# Altium schematic sheet LED_Section.SchDoc
size A4
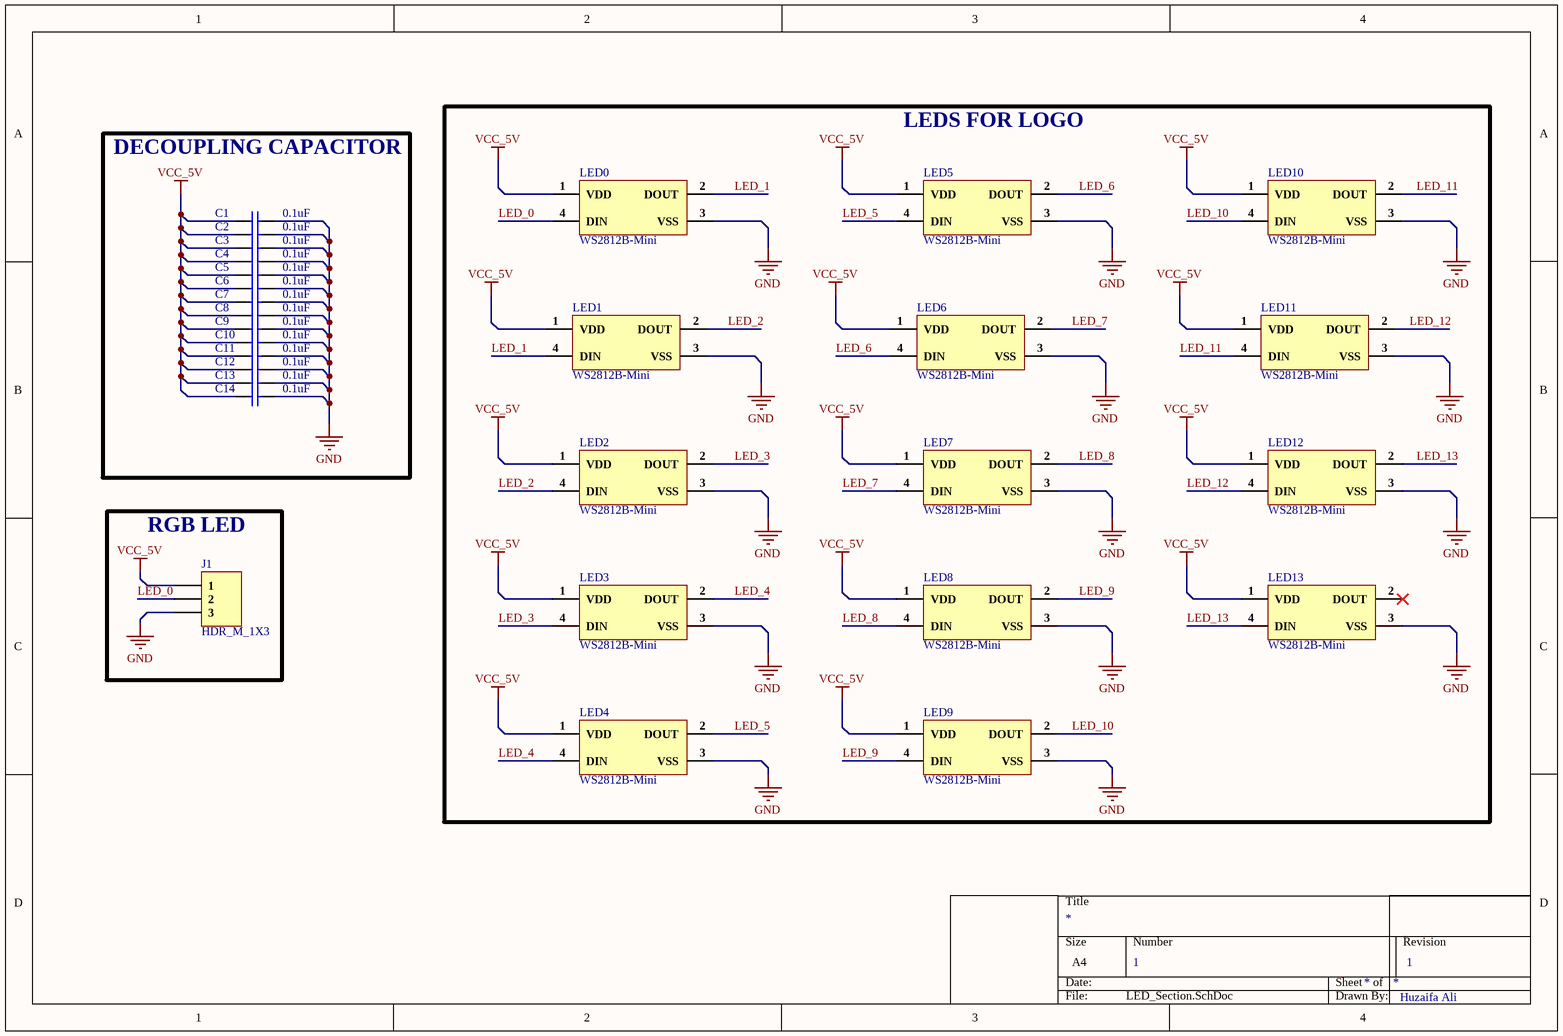
[diagram p0: LED_Section.SchDoc]

## Parts
C1  0.1uF  [CAP 0201]
C2  0.1uF  [CAP 0201]
C3  0.1uF  [CAP 0201]
C4  0.1uF  [CAP 0201]
C5  0.1uF  [CAP 0201]
C6  0.1uF  [CAP 0201]
C7  0.1uF  [CAP 0201]
C8  0.1uF  [CAP 0201]
C9  0.1uF  [CAP 0201]
C10  0.1uF  [CAP 0201]
C11  0.1uF  [CAP 0201]
C12  0.1uF  [CAP 0201]
C13  0.1uF  [CAP 0201]
C14  0.1uF  [CAP 0201]
J1  HDR_M_1X3  [HDR_M_1X3]
LED0  WS2812B-Mini  [WS2812B-Mini]
LED1  WS2812B-Mini  [WS2812B-Mini]
LED2  WS2812B-Mini  [WS2812B-Mini]
LED3  WS2812B-Mini  [WS2812B-Mini]
LED4  WS2812B-Mini  [WS2812B-Mini]
LED5  WS2812B-Mini  [WS2812B-Mini]
LED6  WS2812B-Mini  [WS2812B-Mini]
LED7  WS2812B-Mini  [WS2812B-Mini]
LED8  WS2812B-Mini  [WS2812B-Mini]
LED9  WS2812B-Mini  [WS2812B-Mini]
LED10  WS2812B-Mini  [WS2812B-Mini]
LED11  WS2812B-Mini  [WS2812B-Mini]
LED12  WS2812B-Mini  [WS2812B-Mini]
LED13  WS2812B-Mini  [WS2812B-Mini]

## Blocks framed on the sheet
DECOUPLING CAPACITOR: C1-C14
LEDS FOR LOGO: LED0-LED13
RGB LED: J1

## Nets
GND: C1.2 C2.2 C3.2 C4.2 C5.2 C6.2 C7.2 C8.2 C9.2 C10.2 C11.2 C12.2 C13.2 C14.2 J1.3 LED0.3(VSS) LED1.3(VSS) LED2.3(VSS) LED3.3(VSS) LED4.3(VSS) LED5.3(VSS) LED6.3(VSS) LED7.3(VSS) LED8.3(VSS) LED9.3(VSS) LED10.3(VSS) LED11.3(VSS) LED12.3(VSS) LED13.3(VSS)
VCC_5V: C1.1 C2.1 C3.1 C4.1 C5.1 C6.1 C7.1 C8.1 C9.1 C10.1 C11.1 C12.1 C13.1 C14.1 J1.1 LED0.1(VDD) LED1.1(VDD) LED2.1(VDD) LED3.1(VDD) LED4.1(VDD) LED5.1(VDD) LED6.1(VDD) LED7.1(VDD) LED8.1(VDD) LED9.1(VDD) LED10.1(VDD) LED11.1(VDD) LED12.1(VDD) LED13.1(VDD)
LED_0: J1.2 LED0.4(DIN)
LED_1: LED0.2(DOUT) LED1.4(DIN)
LED_2: LED1.2(DOUT) LED2.4(DIN)
LED_3: LED2.2(DOUT) LED3.4(DIN)
LED_4: LED3.2(DOUT) LED4.4(DIN)
LED_5: LED4.2(DOUT) LED5.4(DIN)
LED_6: LED5.2(DOUT) LED6.4(DIN)
LED_7: LED6.2(DOUT) LED7.4(DIN)
LED_8: LED7.2(DOUT) LED8.4(DIN)
LED_9: LED8.2(DOUT) LED9.4(DIN)
LED_10: LED9.2(DOUT) LED10.4(DIN)
LED_11: LED10.2(DOUT) LED11.4(DIN)
LED_12: LED11.2(DOUT) LED12.4(DIN)
LED_13: LED12.2(DOUT) LED13.4(DIN)

Not connected (* = marked no-connect by the designer): LED13 2(DOUT)*

## Notes on the sheet
- 1
- Huzaifa Ali

## Library data of the parts
C1-C14 = CC0201KRX5R6BB104: Cap Ceramic 0.1uF 10V X5R 10% SMD 0201 85C Paper T/R; Manufacturer: Yageo; Capacitance: 100nF; Supplier 1: Avnet; Manufacturer Part Number: CC0201KRX5R6BB104; RoHS: Yes; Category: Ceramic Capacitors; Stock 1: 2530000; Pricing 1: 15000=0.00489, 30000=0.00489, 60000=0.00488, 90000=0.00488, 120000=0.00487, 150000=0.00486, 1500000=0.00485 (USD); Mount: Surface Mount; Case/Package: 0201; Case Code (Imperial): 0201; Case Code (Metric): 0603; Weight: 6E-06oz; Min Operating Temperature: -55°C; Max Operating Temperature: 85°C; Tolerance: 10%; Dielectric: X5R; Voltage Rating (DC): 10V; Packaging: Tape and Reel; Termination: SMD/SMT; Resistor Type: Ceramic; Voltage Rating: 10V; Series: CC; Construction: Flat; Length: 0.6mm; Width: 0.012inch; Height: 0.3mm; Thickness: 0.013inch; Depth: 0.3mm; Radiation Hardening: No; Lead Free: Lead Free; Halogen Free: Halogen Free; RoHS Compliant: Yes; ComponentLink1URL: https://datasheet.ciiva.com/11587/upy-gphc-x5r-4v-to-50v-12-11587190.pdf?src-supplier=Avnet; ComponentLink1Description: https://datasheet.ciiva.com/11587/upy-gphc-x5r-4v-to-50v-12-11587190.pdf?src-supplier=Avnet; ComponentLink2URL: https://datasheet.ciiva.com/17437/upy-gphc-x5r-4v-to-50v-12-17437495.pdf?src-supplier=Avnet+Europe; ComponentLink2Description: https://datasheet.ciiva.com/17437/upy-gphc-x5r-4v-to-50v-12-17437495.pdf?src-supplier=Avnet+Europe; Supplier Part Number 1: CC0201KRX5R6BB104
J1 = HDR_M_1X3: 3 POS 2.54mm spacer header; Manufacturer: E-SIMPO; Current Rating: 1Amps; Pitch: 2.54mm; ComponentLink1Description: AliE; ComponentLink1URL: https://www.aliexpress.com/item/32896225776.html?spm=a2g0o.productlist.0.0.64116a18Q9OFX2&algo_pvid=aef74b9f-f029-40ba-a87b-4c3df7d87b26&algo_exp_id=aef74b9f-f029-40ba-a87b-4c3df7d87b26-3&pdp_ext_f=%7B%22sku_id%22%3A%2265850500267%22%7D&pdp_pi=-1%3B2.79%3B-1%3BUSD+3.72%40salePrice%3BUSD%3Bsearch-mainSearch
LED0-LED13 = WS2812B-Mini: SMD,3.5x3.5mm Light Emitting Diodes (LED) RoHS; Manufacturer: Worldsemi; ComponentLink1Description: LCSC; ComponentLink1URL: *https://lcsc.com/product-detail/Light-Emitting-Diodes-LED_Worldsemi-WS2812B-Mini_C527089.html; Package: SMD,3.5x3.5mm; Parameter 1: *